# Altium project CAN_Display.PrjPcb (part 2 of 2)

## Sheet 04_MCU.SchDoc
size A3; SheetNumber: 4; SheetTotal: 6
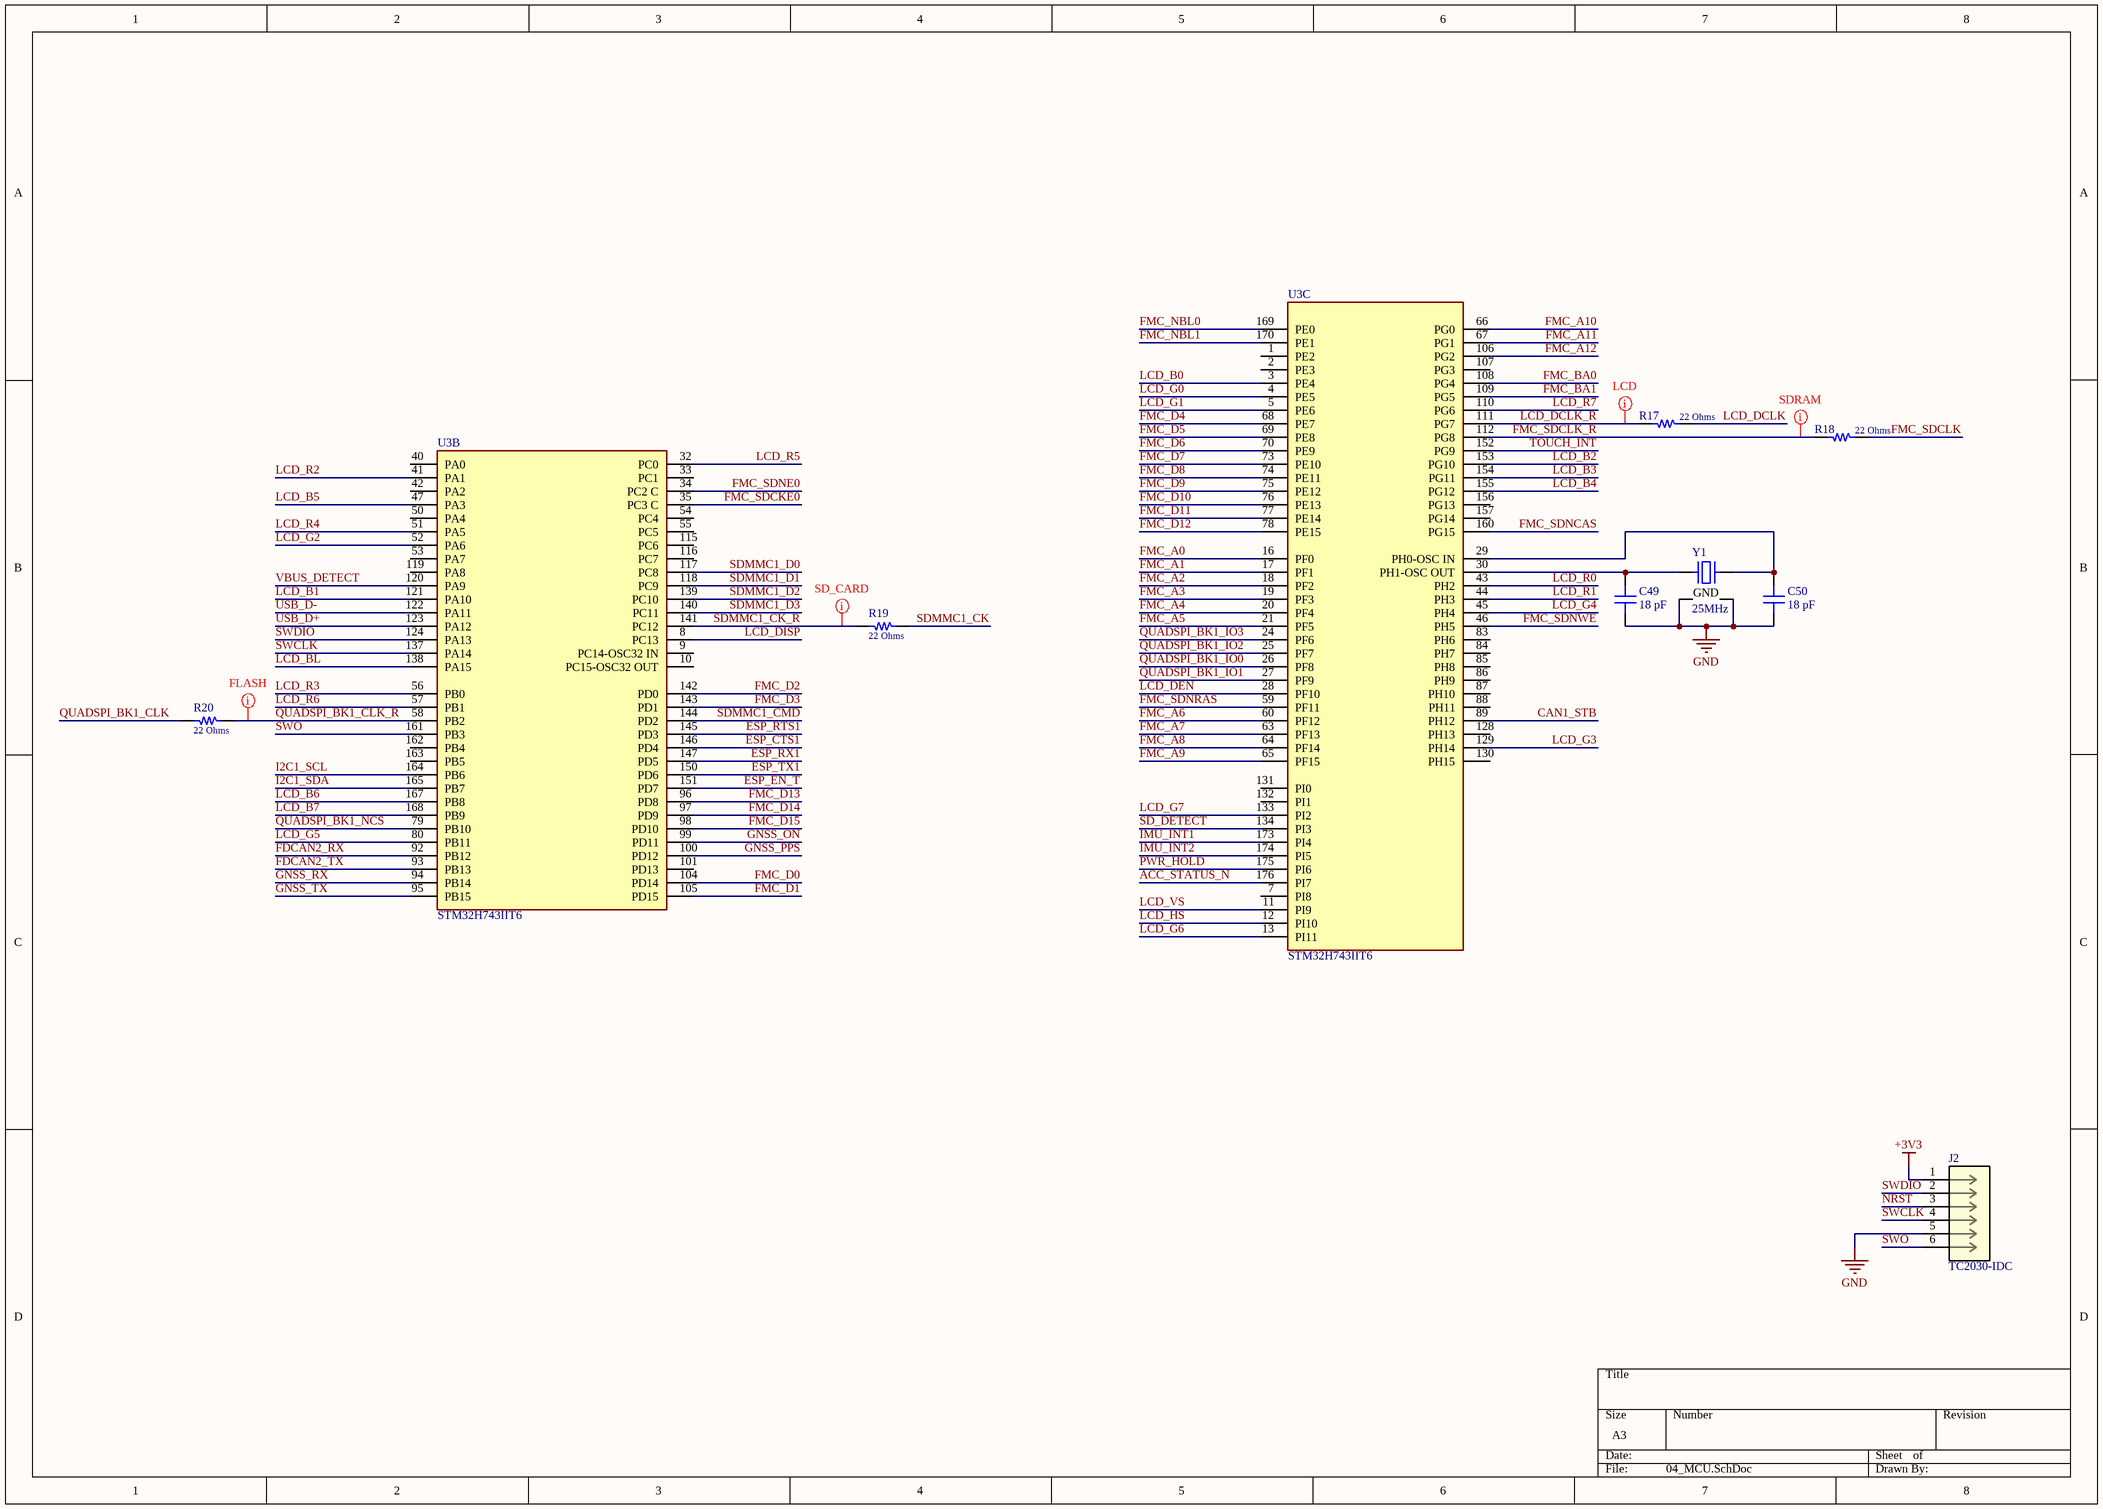
[diagram p3: 04_MCU.SchDoc]

### Parts
C49  18 pF  [CAP 0402_1005]
C50  18 pF  [CAP 0402_1005]
J2  TC2030-IDC  [CONN_TC2030-IDC_TGC]
R17  22 Ohms  [RES 0402_1005]
R18  22 Ohms  [RES 0402_1005]
R19  22 Ohms  [RES 0402_1005]
R20  22 Ohms  [RES 0402_1005]
U3  STM32H743IIT6  [FP-LQFP176-1T-MFG]  (parts B,C of 3)
Y1  25MHz  [NDK NX3225SA]

### Nets
+3V3: J2.1
GND: C49.1 C50.1 J2.5 Y1.2(GND) Y1.4(GND)
ACC_STATUS_N: U3.176(PI7)
CAN1_STB: U3.89(PH12)
ESP_CTS1: U3.146(PD4)
ESP_EN_T: U3.151(PD7)
ESP_RTS1: U3.145(PD3)
ESP_RX1: U3.147(PD5)
ESP_TX1: U3.150(PD6)
FDCAN2_RX: U3.92(PB12)
FDCAN2_TX: U3.93(PB13)
FMC_A0: U3.16(PF0)
FMC_A1: U3.17(PF1)
FMC_A2: U3.18(PF2)
FMC_A3: U3.19(PF3)
FMC_A4: U3.20(PF4)
FMC_A5: U3.21(PF5)
FMC_A6: U3.60(PF12)
FMC_A7: U3.63(PF13)
FMC_A8: U3.64(PF14)
FMC_A9: U3.65(PF15)
FMC_A10: U3.66(PG0)
FMC_A11: U3.67(PG1)
FMC_A12: U3.106(PG2)
FMC_BA0: U3.108(PG4)
FMC_BA1: U3.109(PG5)
FMC_D0: U3.104(PD14)
FMC_D1: U3.105(PD15)
FMC_D2: U3.142(PD0)
FMC_D3: U3.143(PD1)
FMC_D4: U3.68(PE7)
FMC_D5: U3.69(PE8)
FMC_D6: U3.70(PE9)
FMC_D7: U3.73(PE10)
FMC_D8: U3.74(PE11)
FMC_D9: U3.75(PE12)
FMC_D10: U3.76(PE13)
FMC_D11: U3.77(PE14)
FMC_D12: U3.78(PE15)
FMC_D13: U3.96(PD8)
FMC_D14: U3.97(PD9)
FMC_D15: U3.98(PD10)
FMC_NBL0: U3.169(PE0)
FMC_NBL1: U3.170(PE1)
FMC_SDCKE0: U3.35(PC3_C)
FMC_SDCLK: R18.1
FMC_SDCLK_R: R18.2 U3.112(PG8)
FMC_SDNCAS: U3.160(PG15)
FMC_SDNE0: U3.34(PC2_C)
FMC_SDNRAS: U3.59(PF11)
FMC_SDNWE: U3.46(PH5)
GNSS_ON: U3.99(PD11)
GNSS_PPS: U3.100(PD12)
GNSS_RX: U3.94(PB14)
GNSS_TX: U3.95(PB15)
I2C1_SCL: U3.164(PB6)
I2C1_SDA: U3.165(PB7)
IMU_INT1: U3.173(PI4)
IMU_INT2: U3.174(PI5)
LCD_B0: U3.3(PE4)
LCD_B1: U3.121(PA10)
LCD_B2: U3.153(PG10)
LCD_B3: U3.154(PG11)
LCD_B4: U3.155(PG12)
LCD_B5: U3.47(PA3)
LCD_B6: U3.167(PB8)
LCD_B7: U3.168(PB9)
LCD_BL: U3.138(PA15)
LCD_DCLK: R17.1
LCD_DCLK_R: R17.2 U3.111(PG7)
LCD_DEN: U3.28(PF10)
LCD_DISP: U3.8(PC13)
LCD_G0: U3.4(PE5)
LCD_G1: U3.5(PE6)
LCD_G2: U3.52(PA6)
LCD_G3: U3.129(PH14)
LCD_G4: U3.45(PH4)
LCD_G5: U3.80(PB11)
LCD_G6: U3.13(PI11)
LCD_G7: U3.133(PI2)
LCD_HS: U3.12(PI10)
LCD_R0: U3.43(PH2)
LCD_R1: U3.44(PH3)
LCD_R2: U3.41(PA1)
LCD_R3: U3.56(PB0)
LCD_R4: U3.51(PA5)
LCD_R5: U3.32(PC0)
LCD_R6: U3.57(PB1)
LCD_R7: U3.110(PG6)
LCD_VS: U3.11(PI9)
NRST: J2.3
PWR_HOLD: U3.175(PI6)
QUADSPI_BK1_CLK: R20.2
QUADSPI_BK1_CLK_R: R20.1 U3.58(PB2)
QUADSPI_BK1_IO0: U3.26(PF8)
QUADSPI_BK1_IO1: U3.27(PF9)
QUADSPI_BK1_IO2: U3.25(PF7)
QUADSPI_BK1_IO3: U3.24(PF6)
QUADSPI_BK1_NCS: U3.79(PB10)
SD_DETECT: U3.134(PI3)
SDMMC1_CK: R19.1
SDMMC1_CK_R: R19.2 U3.141(PC12)
SDMMC1_CMD: U3.144(PD2)
SDMMC1_D0: U3.117(PC8)
SDMMC1_D1: U3.118(PC9)
SDMMC1_D2: U3.139(PC10)
SDMMC1_D3: U3.140(PC11)
SWCLK: J2.4 U3.137(PA14)
SWDIO: J2.2 U3.124(PA13)
SWO: J2.6 U3.161(PB3)
TOUCH_INT: U3.152(PG9)
USB_D+: U3.123(PA12)
USB_D-: U3.122(PA11)
VBUS_DETECT: U3.120(PA9)
NetC49_2: C49.2 U3.30(PH1-OSC_OUT) Y1.1
NetC50_2: C50.2 U3.29(PH0-OSC_IN) Y1.3

Not connected (* = marked no-connect by the designer): U3 1(PE2) 2(PE3) 7(PI8) 9(PC14-OSC32_IN) 10(PC15-OSC32_OUT) 33(PC1) 40(PA0) 42(PA2) 50(PA4) 53(PA7) 54(PC4) 55(PC5) 83(PH6) 84(PH7) 85(PH8) 86(PH9) 87(PH10) 88(PH11) 101(PD13) 107(PG3) 115(PC6) 116(PC7) 119(PA8) 128(PH13) 130(PH15) 131(PI0) 132(PI1) 156(PG13) 157(PG14) 162(PB4) 163(PB5)

### Layout directives
mark named SD_CARD: SDMMC1_CK_R
mark named FLASH: QUADSPI_BK1_CLK_R
mark named SDRAM: FMC_SDCLK_R
mark named LCD: LCD_DCLK_R

### Library data of the parts
C49 C50 = CC0402JRNPO9BN180: CAP CER 18PF 50V C0G/NPO 0402; Manufacturer: Yageo; id: 1151; Temperature Coefficient: C0G, NP0; Tolerance: ±5%; Part Number: CC0402JRNPO9BN180; Value: 18 pF; Supplier Part Number 1: 311-1415-1-ND; ComponentLink2Description: DigiKey Link; ComponentLink1URL: https://www.yageo.com/upload/media/product/productsearch/datasheet/mlcc/UPY-GP_NP0_16V-to-50V_17.pdf; PartId: 4846; Supplier 1: DigiKey; Series: CC; LastUpdated: 2023-01-03T20:04:10.103; Part Status: Active; Capacitance: 18 pF; Device Package: 0402 (1005 Metric); Thickness (Max): 0.022" (0.55mm); Voltage - Rated: 50V; Minimum Order: 1; Packaging: CutTape; Applications: General Purpose; Package / Case: 0402 (1005 Metric); ComponentLink1Description: Datasheet; Price: 0.01; ComponentLink2URL: https://www.digikey.com/en/products/detail/yageo/CC0402JRNPO9BN180/2833580; Lifecycle Status: Active; Operating Temperature: -55°C ~ 125°C; Size / Dimension: 0.039" L x 0.020" W (1.00mm x 0.50mm); Mounting Type: Surface Mount, MLCC
J2 = TC2030-IDC: Description; Manufacturer_Name: Tag-Connect; Copyright: Copyright (C) 2025 Ultra Librarian. All rights reserved.; Manufacturer_Part_Number: TC2030-IDC; RefDes: RefDes; Type: Type
R17-R20 = RC0402FR-0722RL: RES 22 OHM 1% 1/16W 0402; Manufacturer: Yageo; id: 7818; Temperature Coefficient: ±100ppm/°C; Power (Watts): 0.063W, 1/16W; Part Number: RC0402FR-0722RL; Height - Seated (Max): 0.016" (0.40mm); Supplier Part Number 1: 311-22.0LRCT-ND; Supplier Device Package: 0402; ComponentLink1Description: Datasheet; ComponentLink2URL: https://www.digikey.com/en/products/detail/yageo/RC0402FR-0722RL/726562; Features: Moisture Resistant; ComponentLink1URL: https://www.yageo.com/upload/media/product/productsearch/datasheet/rchip/PYu-RC_Group_51_RoHS_L_10.pdf; Composition: Thick Film; Tolerance: ±1%; Supplier 1: DigiKey; Series: RC_L; Part Status: Active; ComponentLink2Description: DigiKey Link; Device Package: 0402 (1005 Metric); Packaging: CutTape; Minimum Order: 1; Package / Case: 0402 (1005 Metric); PartId: 17600; Lifecycle Status: Active; LastUpdated: 2023-01-02T20:20:45.730; Operating Temperature: -55°C ~ 155°C; Number Of Terminations: 2; Value: 22 Ohms; Size / Dimension: 0.039" L x 0.020" W (1.00mm x 0.50mm); Price: 0.01; Resistance: 22 Ohms
U3 = CMP-12105-000078-1: IC MCU 32BIT 2MB FLASH 176LQFP; Manufacturer: STMicroelectronics; Number Of I/Os: 140; Number Of Pwm Channels: 2; Standoff Height: 0.05mm; Number Of Uart Channels: 9; Frequency: 400MHz; Core Architecture: ARM Cortex-M7; Ram Size: 1MBytes; Max Supply Voltage: 3.6V; Number Of Timers/Counters: 20; Min Supply Voltage: 1.62V; Number Of I2C Channels: 4; Number Of Cores: 1; Max Junction Temp: +125°C; Data Bus Width: 32bits; Memory Size: 2MBytes; Number Of Adc Channels: 36; Number Of Spi Channels: 6; Interface: I2C,SPI,UART,USART,CAN,USB,LIN,IrDA,Ethernet,SMBus,Other; Number Of A/D Converters: 3; Digikey Description: IC MCU 32BIT 2MB FLASH 176LQFP; Temperature: -40°C to +125°C; Package: LQFP176-1T; RoHS: TRUE; Memory Type: FLASH; Device Class L3: Microcontrollers; Manufacturer Part Number: STM32H743IIT6; Mouser Description: MCU 32-Bit STM32 ARM Cortex M7 RISC 2MB Flash 1.8V/2.5V/3.3V 176-Pin LQFP Tray; Category: IC; Automotive: No; Ambient Temperature Range High: +85°C; Number Of Usb Channels: 2; ComponentLink2URL: https://www.st.com/resource/en/datasheet/stm32h743ii.pdf; Lead Free: Yes; Ambient Temperature Range Low: -40°C; ComponentLink2Description: Datasheet; Device Class L2: Embedded Processors and Controllers; Octopart: https://octopart.com/stm32h743iit6-stmicroelectronics-76372526; Device Class L1: Integrated Circuits (ICs); Height: 1.6mm; Temperature Range Low: -40°C; Temperature Range High: +125°C; Number Of Ethernet Channels: 1; Ipc Land Pattern Name: QFP50P2600X2600X160-176
Y1 = YXC X322525MOB4SI: CRYSTAL 25MHz 12pF SMD; Value: 25MHz

## Sheet 05_Peripherals.SchDoc
size A3; SheetNumber: 5; SheetTotal: 6
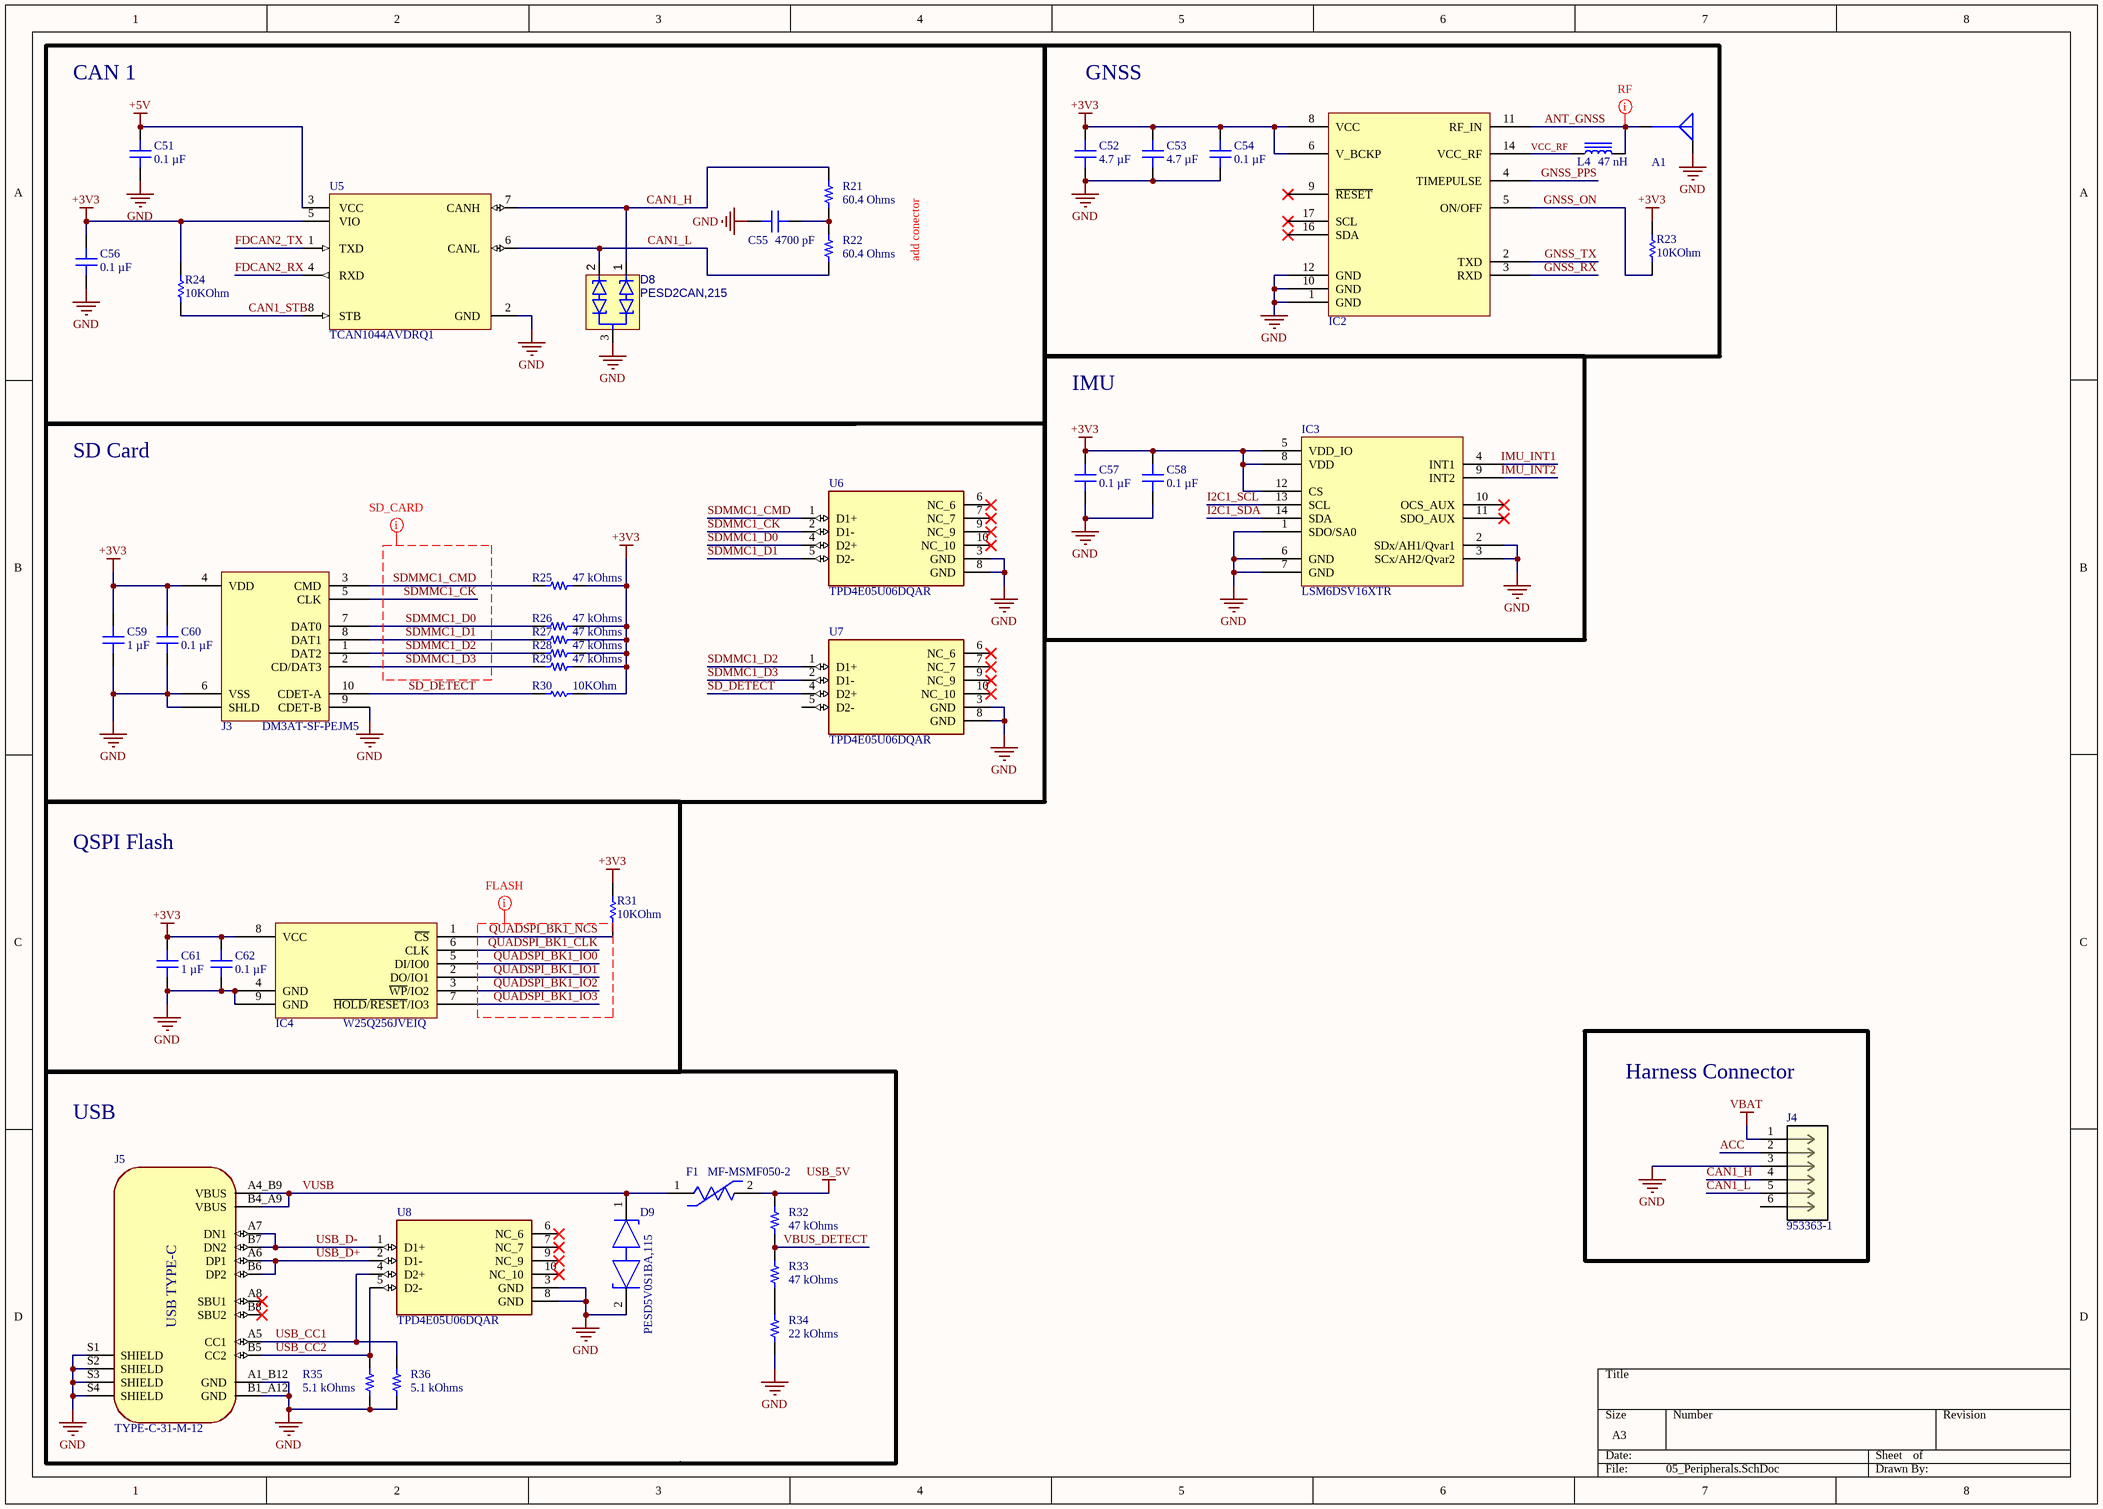
[diagram p4: 05_Peripherals.SchDoc]

### Parts
A1  1909763-1  [TE C-1909763]  (value not drawn)
C51  0.1 µF  [CAP 0402_1005]
C52  4.7 µF  [CAP 0603_1608]
C53  4.7 µF  [CAP 0603_1608]
C54  0.1 µF  [CAP 0402_1005]
C55  4700 pF  [CAP 0402_1005]
C56  0.1 µF  [CAP 0402_1005]
C57  0.1 µF  [CAP 0402_1005]
C58  0.1 µF  [CAP 0402_1005]
C59  1 µF  [CAP 0603_1608]
C60  0.1 µF  [CAP 0402_1005]
C61  1 µF  [CAP 0603_1608]
C62  0.1 µF  [CAP 0402_1005]
D8  PESD2CAN,215  [SOT95P230X110-3N]
D9  PESD5V0S1BA,115  [FP-SOD323-CA-MFG]
F1  MF-MSMF050-2  [FP-MF-MSMF050-2-MFG]
IC2  ATGM336H-5N  [U-BLOX MAX-8Q]  (value not drawn)
IC3  LSM6DSV16XTR  [STM LGA-14L 2.5x3.0MM]
IC4  W25Q256JVEIQ  [WINBOND WSON-8 8x6MM E]
J3  DM3AT-SF-PEJM5  [HIROSE DM3AT-SF-PEJM5]
J4  953363-1  [CONN6_953363-1_TEC]
J5  TYPE-C-31-M-12  [HRO_TYPE-C-31-M-12]
L4  47 nH  [IND 0402_1005 RF WW]
R21  60.4 Ohms  [RES 0603_1608]
R22  60.4 Ohms  [RES 0603_1608]
R23  10KOhm  [RESC1005X40X25LL05T05]
R24  10KOhm  [RESC1005X40X25LL05T05]
R25  47 kOhms  [RES 0402_1005]
R26  47 kOhms  [RES 0402_1005]
R27  47 kOhms  [RES 0402_1005]
R28  47 kOhms  [RES 0402_1005]
R29  47 kOhms  [RES 0402_1005]
R30  10KOhm  [RESC1005X40X25LL05T05]
R31  10KOhm  [RESC1005X40X25LL05T05]
R32  47 kOhms  [RES 0402_1005]
R33  47 kOhms  [RES 0402_1005]
R34  22 kOhms  [RES 0402_1005]
R35  5.1 kOhms  [RES 0402_1005]
R36  5.1 kOhms  [RES 0402_1005]
U5  TCAN1044AVDRQ1  [D0008A_MFG]
U6  TPD4E05U06DQAR  [IC_TPD4E05U06DQAR]
U7  TPD4E05U06DQAR  [IC_TPD4E05U06DQAR]
U8  TPD4E05U06DQAR  [IC_TPD4E05U06DQAR]

### Blocks framed on the sheet
GNSS: A1 C52-C54 IC2 L4 R23
IMU: C57 C58 IC3
SD Card: C59 C60 J3 R25-R30 U6 U7
QSPI Flash: C61 C62 IC4 R31
Harness Connector: J4
USB: D9 F1 J5 R32-R36 U8

### Nets
+3V3: C52.2 C53.2 C54.2 C56.2 C57.2 C58.2 C59.2 C60.2 C61.2 C62.2 IC2.6(V_BCKP) IC2.8(VCC) IC3.5(VDD_IO) IC3.8(VDD) IC3.12(CS) IC4.8(VCC) J3.4(VDD) R23.1 R24.1 R25.1 R26.1 R27.1 R28.1 R29.1 R30.1 R31.1 U5.5(VIO)
+5V: C51.2 U5.3(VCC)
GND: A1.G C51.1 C52.1 C53.1 C54.1 C55.1 C56.1 C57.1 C58.1 C59.1 C60.1 C61.1 C62.1 D8.3 D9.2(K2) IC2.1(GND) IC2.10(GND) IC2.12(GND) IC3.1(SDO/SA0) IC3.2(SDx/AH1/Qvar1) IC3.3(SCx/AH2/Qvar2) IC3.6(GND) IC3.7(GND) IC4.4(GND) IC4.9(GND) J3.6(VSS) J3.9(CDET-B) J3.S(SHLD) J4.3 J5.A1_B12(GND) J5.B1_A12(GND) J5.S1(SHIELD) J5.S2(SHIELD) J5.S3(SHIELD) J5.S4(SHIELD) R34.1 R35.1 R36.1 U5.2(GND) U6.3(GND) U6.8(GND) U7.3(GND) U7.8(GND) U8.3(GND) U8.8(GND)
USB_5V: F1.2 R32.2
VBAT: J4.1
ACC: J4.2
ANT_GNSS: A1.S IC2.11(RF_IN) L4.2
CAN1_H: D8.1 J4.4 R21.2 U5.7(CANH)
CAN1_L: D8.2 J4.5 R22.1 U5.6(CANL)
CAN1_STB: R24.2 U5.8(STB)
FDCAN2_RX: U5.4(RXD)
FDCAN2_TX: U5.1(TXD)
GNSS_ON: IC2.5(ON/OFF) R23.2
GNSS_PPS: IC2.4(TIMEPULSE)
GNSS_RX: IC2.3(RXD)
GNSS_TX: IC2.2(TXD)
I2C1_SCL: IC3.13(SCL)
I2C1_SDA: IC3.14(SDA)
IMU_INT1: IC3.4(INT1)
IMU_INT2: IC3.9(INT2)
QUADSPI_BK1_CLK: IC4.6(CLK)
QUADSPI_BK1_IO0: IC4.5(DI/IO0)
QUADSPI_BK1_IO1: IC4.2(DO/IO1)
QUADSPI_BK1_IO2: IC4.3(~{WP}/IO2)
QUADSPI_BK1_IO3: IC4.7(~{HOLD}/~{RESET}/IO3)
QUADSPI_BK1_NCS: IC4.1(~{CS}) R31.2
SD_DETECT: J3.10(CDET-A) R30.2 U7.4(D2+)
SDMMC1_CK: J3.5(CLK) U6.2(D1-)
SDMMC1_CMD: J3.3(CMD) R25.2 U6.1(D1+)
SDMMC1_D0: J3.7(DAT0) R26.2 U6.4(D2+)
SDMMC1_D1: J3.8(DAT1) R27.2 U6.5(D2-)
SDMMC1_D2: J3.1(DAT2) R28.2 U7.1(D1+)
SDMMC1_D3: J3.2(CD/DAT3) R29.2 U7.2(D1-)
USB_CC1: J5.A5(CC1) R36.2 U8.4(D2+)
USB_CC2: J5.B5(CC2) R35.2 U8.5(D2-)
USB_D+: J5.A6(DP1) J5.B6(DP2) U8.2(D1-)
USB_D-: J5.A7(DN1) J5.B7(DN2) U8.1(D1+)
VBUS_DETECT: R32.1 R33.2
VCC_RF: IC2.14(VCC_RF) L4.1
VUSB: D9.1(K1) F1.1 J5.A4_B9(VBUS) J5.B4_A9(VBUS)
NetC55_2: C55.2 R21.1 R22.2
NetR33_1: R33.1 R34.2

Not connected (* = marked no-connect by the designer): IC2 9(~{RESET})* 16(SDA)* 17(SCL)*; IC3 10(OCS_AUX)* 11(SDO_AUX)*; J4 6; J5 A8(SBU1)* B8(SBU2)*; U6 6(NC_6)* 7(NC_7)* 9(NC_9)* 10(NC_10)*; U7 5(D2-) 6(NC_6)* 7(NC_7)* 9(NC_9)* 10(NC_10)*; U8 6(NC_6)* 7(NC_7)* 9(NC_9)* 10(NC_10)*

### Layout directives
mark named SD_CARD: SDMMC1_CK, SDMMC1_CMD, SDMMC1_D0, SDMMC1_D1, SDMMC1_D2, SDMMC1_D3
mark named FLASH: QUADSPI_BK1_CLK, QUADSPI_BK1_IO0, QUADSPI_BK1_IO1, QUADSPI_BK1_IO2, QUADSPI_BK1_IO3, QUADSPI_BK1_NCS
net class RF: ANT_GNSS

### Notes on the sheet
- CAN 1
- add conector
- (in symbol TYPE-C-31-M-12) USB TYPE-C

### Library data of the parts
A1 = 1909763-1: CONN UMCC JACK STR 50OHM SMD; Manufacturer: TE Connectivity AMP Connectors; id: 12; Contact Termination: Solder; Connector Type: Jack, Male Pin; Number Of Ports: 1; Connector Style: U.FL (UMCC); Frequency - Max: 6 GHz; Part Number: 1909763-1; Housing Color: Ivory; Supplier Part Number 1: A118077CT-ND; ComponentLink1Description: Datasheet; ComponentLink2URL: https://www.digikey.com/en/products/detail/te-connectivity-amp-connectors/1909763-1/4731728; ComponentLink1URL: https://www.te.com/commerce/DocumentDelivery/DDEController?Action=srchrtrv&DocNm=1909763&DocType=Customer+Drawing&DocLang=English; Fastening Type: Snap-On; Supplier 1: DigiKey; Series: -; Part Status: Active; Shield Termination: Solder; ComponentLink2Description: DigiKey Link; Packaging: TapeAndReel; Minimum Order: 1; Lifecycle Status: Active; LastUpdated: 2022-06-29T18:17:07.053; Mounting Type: Surface Mount; Impedance: 50Ohm; Price: 0.23
C51 C54 C56-C58 C60 C62 = CL05B104KO5NNNC: CAP CER 0.1UF 16V X7R 0402; Manufacturer: Samsung Electro-Mechanics; id: 1479; Tolerance: ±10%; Part Number: CL05B104KO5NNNC; Value: 0.1 µF; Temperature Coefficient: X7R; Supplier Part Number 1: 1276-1001-1-ND; ComponentLink2Description: DigiKey Link; ComponentLink1URL: http://www.samsungsem.com/kr/support/product-search/mlcc/CL05B104KO5NNNC.jsp; PartId: 6066; Supplier 1: DigiKey; Series: CL; LastUpdated: 2023-01-03T20:04:06.380; Part Status: Active; Capacitance: 0.1 µF; Device Package: 0402 (1005 Metric); Thickness (Max): 0.022" (0.55mm); Voltage - Rated: 16V; Minimum Order: 1; Packaging: CutTape; Applications: General Purpose; Package / Case: 0402 (1005 Metric); ComponentLink1Description: Datasheet; Price: 0.01; ComponentLink2URL: https://www.digikey.com/en/products/detail/samsung-electro-mechanics/CL05B104KO5NNNC/3886659; Lifecycle Status: Active; Operating Temperature: -55°C ~ 125°C; Size / Dimension: 0.039" L x 0.020" W (1.00mm x 0.50mm); Mounting Type: Surface Mount, MLCC
C52 C53 = CL10A475KP8NNNC: CAP CER 4.7UF 10V X5R 0603; Manufacturer: Samsung Electro-Mechanics; id: 830; Tolerance: ±10%; Part Number: CL10A475KP8NNNC; Value: 4.7 µF; Temperature Coefficient: X5R; Supplier Part Number 1: 1276-1044-1-ND; ComponentLink2Description: DigiKey Link; ComponentLink1URL: http://www.samsungsem.com/kr/support/product-search/mlcc/CL10A475KP8NNNC.jsp; PartId: 5671; Supplier 1: DigiKey; Series: CL; LastUpdated: 2023-01-03T20:07:38.840; Part Status: Active; Capacitance: 4.7 µF; Device Package: 0603 (1608 Metric); Thickness (Max): 0.035" (0.90mm); Voltage - Rated: 10V; Minimum Order: 1; Packaging: TapeAndReel; Applications: General Purpose; Package / Case: 0603 (1608 Metric); ComponentLink1Description: Datasheet; Price: 0.01; ComponentLink2URL: https://www.digikey.com/en/products/detail/samsung-electro-mechanics/CL10A475KP8NNNC/3886702; Lifecycle Status: Active; Operating Temperature: -55°C ~ 85°C; Size / Dimension: 0.063" L x 0.031" W (1.60mm x 0.80mm); Mounting Type: Surface Mount, MLCC
C55 = C0402C472K4RECAUTO: CAP CER 0402 4.7NF 16V X7R 10%; Manufacturer: KEMET; id: 3032; Part Number: C0402C472K4RECAUTO; Value: 4700 pF; Temperature Coefficient: X7R; Supplier Part Number 1: 399-17875-1-ND; ComponentLink2Description: DigiKey Link; ComponentLink1URL: https://api.kemet.com/component-edge/download/datasheet/C0402C472K4RECAUTO.pdf; PartId: 12122; Tolerance: ±10%; Supplier 1: DigiKey; Series: ESD SMD Auto X7R; LastUpdated: 2023-01-03T20:03:46.940; Part Status: Active; Capacitance: 4700 pF; Device Package: 0402 (1005 Metric); Ratings: AEC-Q200; Thickness (Max): 0.022" (0.55mm); Voltage - Rated: 16V; Minimum Order: 1; Packaging: TapeAndReel; Applications: Automotive, ESD Protection; Package / Case: 0402 (1005 Metric); ComponentLink1Description: Datasheet; Price: 0.01; ComponentLink2URL: https://www.digikey.com/en/products/detail/kemet/C0402C472K4RECAUTO/8640469; Lifecycle Status: Active; Operating Temperature: -55°C ~ 125°C; Size / Dimension: 0.039" L x 0.020" W (1.00mm x 0.50mm); Mounting Type: Surface Mount, MLCC
C59 C61 = C0603C105K4RACAUTO: CAP CER 1UF 16V X7R 0603; Manufacturer: KEMET; id: 14; Tolerance: ±10%; Part Number: C0603C105K4RACAUTO; Value: 1 µF; Temperature Coefficient: X7R; Supplier Part Number 1: 399-17704-2-ND; ComponentLink2Description: DigiKey Link; ComponentLink1URL: https://api.kemet.com/component-edge/download/datasheet/C0603C105K4RACAUTO.pdf; PartId: 2179; Supplier 1: DigiKey; Series: SMD Auto X7R; LastUpdated: 2023-01-03T20:07:48.393; Part Status: Active; Capacitance: 1 µF; Device Package: 0603 (1608 Metric); Ratings: AEC-Q200; Thickness (Max): 0.037" (0.95mm); Voltage - Rated: 16V; Minimum Order: 0; Applications: Automotive, Bypass, Decoupling; Package / Case: 0603 (1608 Metric); ComponentLink1Description: Datasheet; Price: 0; ComponentLink2URL: https://www.digikey.com/en/products/detail/kemet/C0603C105K4RACAUTO/8635831; Lifecycle Status: Active; Operating Temperature: -55°C ~ 125°C; Size / Dimension: 0.063" L x 0.031" W (1.60mm x 0.80mm); Mounting Type: Surface Mount, MLCC
D8 = CMP-004-00031-1: 5A 230W 41V 26.2V Bidirectional 24V SOT-23 ESD and Surge Protection (TVS/ESD) ROHS; Manufacturer Lifecycle Status: RELEASED FOR SUPPLY; Element Configuration: Dual; Peak Reverse Current: 10nA; Power Line Protection: No; Number of Bidirectional Channels: 2; Leakage Current: 50nA; Breakdown Voltage: 28V; Number of Channels: 1; Value: 17pF; ESD Protection: Yes; Max Breakdown Voltage: 30.3V; Max Junction Temperature (Tj): 150°C; Test Current: 1mA; Pins: 3; Composition: Zener; Case/Package: SOT-23; Width: 1.4mm; China RoHS: Compliant; Ratings: AEC-Q101; Depth: 1.4mm; Max Operating Temperature: 150°C; Clamping Voltage: 41V; Min Breakdown Voltage: 26.2V; Termination: SMD/SMT; Peak Pulse Power: 230W; Peak Pulse Current: 5A; Height: 1.1mm; Contact Plating: Tin; Min Operating Temperature: -55°C; Mounting Technology: Surface Mount; Ambient Temperature Range High: 150°C; RoHS: Compliant; Max Reverse Leakage Current: 10nA; Reverse Breakdown Voltage: 26.2V; Number of Terminals: 3; Reverse Standoff Voltage: 24V; Polarity: Bidirectional; Schedule B: 8541100050, 8541100050; REACH SVHC: Unaffected; Length: 3mm; Number of Elements: 1; Working Voltage: 24V; Max Surge Current: 5A; Operating Supply Voltage: 24V; Radiation Hardening: No; Lead Free: Lead Free; Max Power Dissipation: 230W; Direction: Bidirectional; Weight: 4.535924g; Lifecycle Status: Production
D9 = CMP-14432-000001-1: TVS DIODE 5V 14V SOD323
F1 = CMP-2100-03653-2: PTC RESET FUSE 15V 500MA 1812; Manufacturer: Bourns; Value: 0.15-1Ω; Trip Current: 1A; Automotive Grade: Grade 3; Trip Time: 0.15s; Current Rating: 100A; Hold Current: 0.5A; Height: 0.85mm; Package: 1812; Voltage Rating: 15V; Temperature Range High: +85°C; Device Class L2: PTC Resettable Fuses; Lead Free: Yes; ComponentLink2URL: http://www.bourns.com/docs/Product-Datasheets/mfmsmf.pdf; Ambient Temperature Range High: +85°C; Mouser Description: PTC Resettable Fuse 0.5A(hold) 1A(trip) 15V 100A 0.8W 0.15s 0.15Ohm SMD Solder Pad 1812 T/R; Digikey Description: PTC RESET FUSE 15V 500MA 1812; Manufacturer Part Number: MF-MSMF050-2; Resistance: 0.15-1Ω; Category: Fuse; ComponentLink2Description: Datasheet; Automotive: Yes; Temperature Range Low: -40°C; RoHS: TRUE; Device Class L1: Circuit Protection; Temperature: -40°C to +85°C; Octopart: https://octopart.com/mf-msmf050-2-bourns-28047; Ambient Temperature Range Low: -40°C; Device Class L3: unset
IC2 = ATGM336H-5N: RF RX GLONASS/GNSS/GPS 1.575GHZ; id: 1; Voltage - Supply: 2.7V ~ 3.6V; Data Interface: I²C, UART; Part Number: ATGM336H-5N; ComponentLink1Description: Datasheet; ComponentLink1URL: https://github.com/YahboomTechnology/GPS_Module/blob/main/1.GPS%20module%20information/ATGM336H-5N%20Datasheet_EN.pdf; Series: ATGM336H-5N
IC3 = STM LSM6DSV16X: INEMO 3D ACCELEROMETER AND 3D GY; Manufacturer: STMicroelectronics; id: 1; Output Type: I2C, SPI; Sensor Type: Accelerometer, Gyroscope, Temperature, 6 Axis; Part Number: LSM6DSV16XTR; ComponentLink2URL: https://www.digikey.com/en/products/detail/stmicroelectronics/LSM6DSV16XTR/16841485; Price: 2.76; Supplier 1: DigiKey; ComponentLink1Description: Datasheet; ComponentLink2Description: DigiKey Link; Minimum Order: 1; Supplier Part Number 1: 497-LSM6DSV16XTRCT-ND; Operating Temperature: -40°C ~ 85°C; Mounting Type: Surface Mount; Supplier Device Package: 14-LGA (2.5x3); ComponentLink1URL: https://www.st.com/content/ccc/resource/technical/document/datasheet/group3/47/03/b2/44/47/32/4b/76/DM00741844/files/DM00741844.pdf/jcr:content/translations/en.DM00741844.pdf; Packaging: TapeAndReel; Series: -; LastUpdated: 2026-02-04T10:16:47.433; Lifecycle Status: Active
IC4 = W25Q256JVEIQ: IC FLASH 256MBIT SPI/QUAD 8WSON; Manufacturer: Winbond Electronics; id: 620; Memory Size: 256Mb (32M x 8); Voltage - Supply: 2.7V ~ 3.6V; Write Cycle Time - Word, Page: 3ms; Memory Type: Non-Volatile; Clock Frequency: 133 MHz; Memory Interface: SPI - Quad I/O; Part Number: W25Q256JVEIQ; Supplier Part Number 1: W25Q256JVEIQ-ND; Supplier Device Package: 8-WSON (8x6); ComponentLink1Description: Datasheet; Memory Format: FLASH; ComponentLink2URL: https://www.digikey.com/en/products/detail/winbond-electronics/W25Q256JVEIQ/6810681; ComponentLink1URL: http://www.winbond.com/resource-files/w25q256jv%20spi%20revg%2008032017.pdf; Supplier 1: DigiKey; Series: SpiFlash®; Part Status: Active; ComponentLink2Description: DigiKey Link; Packaging: Tube; Minimum Order: 1; Package / Case: 8-WDFN Exposed Pad; PartId: 1453; Lifecycle Status: Active; LastUpdated: 2024-08-29T14:07:08.517; Technology: FLASH - NOR; Operating Temperature: -40°C ~ 85°C (TA); Mounting Type: Surface Mount; Price: 2.50
J3 = DM3AT-SF-PEJM5: CONN MICRO SD CARD PUSH-PUSH R/A; Manufacturer: Hirose Electric Co Ltd; id: 1; Connector Type: Connector and Ejector; Number Of Positions: 10 (8 + 2); Insertion, Removal Method: Push In, Push Out; Card Type: Secure Digital - microSD™; Part Number: DM3AT-SF-PEJM5; Height Above Board: 0.066" (1.68mm); Supplier Part Number 1: HR1964TR-ND; ComponentLink1Description: Datasheet; ComponentLink2URL: //digikey.com/product-detail/en/hirose-electric-co-ltd/DM3AT-SF-PEJM5/HR1964TR-ND/2533565; Features: Switch; ComponentLink1URL: https://www.hirose.com/product/document?clcode=CL0609-0033-6-00&productname=DM3AT-SF-PEJ2M5&series=DM3&documenttype=Catalog&lang=en&documentid=D49662_en; Mounting Feature: Normal, Standard - Top; Supplier 1: DigiKey; Series: DM3; Part Status: Active; ComponentLink2Description: DigiKey Link; Packaging: TapeAndReel; Minimum Order: 1; Contact Finish: Gold; Lifecycle Status: 0; LastUpdated: 2019-12-16T20:34:40.023; Mounting Type: Surface Mount, Right Angle; Price: 1.41
J4 = 953363-1: 6pos MQS .63 header 180deg; Manufacturer_Name: TE Connectivity; TYPE: -; Copyright: Copyright (C) 2026 Ultra Librarian. All rights reserved.; Manufacturer_Part_Number: 953363-1; Datasheet: https://www.te.com/commerce/DocumentDelivery/DDEController?Action=srchrtrv&DocNm=108-15199&DocType=Specification+Or+Standard&DocLang=English&PartCntxt=953363-3&DocFormat=pdf; RefDes: RefDes
J5 = TYPE-C-31-M-12: USB Connectors 24 Receptacle 1 8.94*7.3mm RoHS; MF: HRO Electronics Co., Ltd.; SnapEDA_Link: https://www.snapeda.com/parts/TYPE-C-31-M-12/HRO+Electronics+Co.%252C+Ltd./view-part/?ref=snap; Package: Package; Value: *; MP: TYPE-C-31-M-12; Check_prices: https://www.snapeda.com/parts/TYPE-C-31-M-12/HRO+Electronics+Co.%252C+Ltd./view-part/?ref=eda
L4 = LQW15AN47NJ00D: FIXED IND 47NH 210MA 1.08OHM SMD; Manufacturer: Murata Electronics; id: 266; Frequency - Self Resonant: 2.9GHz; Tolerance: ±5%; Type: Wirewound; Inductance Frequency - Test: 100 MHz; Q @ Freq: 25 @ 200MHz; Material - Core: Non-Magnetic; DC Resistance (DCR): 1.08Ohm Max; Shielding: Unshielded; Part Number: LQW15AN47NJ00D; Height - Seated (Max): 0.024" (0.60mm); Supplier Part Number 1: 490-1154-1-ND; Current Rating (Amps): 210 mA; Inductance: 47 nH; ComponentLink1Description: Datasheet; ComponentLink2URL: https://www.digikey.com/en/products/detail/murata-electronics/LQW15AN47NJ00D/584363; ComponentLink1URL: https://search.murata.co.jp/Ceramy/image/img/P02/JELF243A-0050.pdf; Supplier 1: DigiKey; Series: LQW15; Part Status: Active; ComponentLink2Description: DigiKey Link; Device Package: 0402 (1005 Metric); Packaging: TapeAndReel; Minimum Order: 1; Package / Case: 0402 (1005 Metric); PartId: 266; Lifecycle Status: Active; LastUpdated: 2023-01-02T20:59:31.513; Operating Temperature: -55°C ~ 125°C; Value: 47 nH; Size / Dimension: 0.039" L x 0.020" W (1.00mm x 0.50mm); Mounting Type: Surface Mount; Price: 0.05
R21 R22 = ERJ-PA3F60R4V: RES SMD 60.4 OHM 1% 1/3W 0603; Manufacturer: Panasonic Electronic Components; id: 21330; Temperature Coefficient: ±100ppm/°C; Power (Watts): 0.333W, 1/3W; Part Number: ERJ-PA3F60R4V; Height - Seated (Max): 0.022" (0.55mm); Supplier Part Number 1: 10-ERJ-PA3F60R4VCT-ND; Supplier Device Package: 0603; ComponentLink1Description: Datasheet; ComponentLink2URL: https://www.digikey.com/en/products/detail/panasonic-electronic-components/ERJ-PA3F60R4V/5037768; Features: Automotive AEC-Q200, Pulse Withstanding; ComponentLink1URL: https://industrial.panasonic.com/cdbs/www-data/pdf/RDO0000/AOA0000C331.pdf; Composition: Thick Film; Tolerance: ±1%; Supplier 1: DigiKey; Series: ERJ-PA3; ComponentLink2Description: DigiKey Link; Device Package: 0603 (1608 Metric); Packaging: TapeAndReel; Ratings: AEC-Q200; Minimum Order: 1; Package / Case: 0603 (1608 Metric); PartId: 82262; Lifecycle Status: Active; LastUpdated: 2023-10-29T19:35:03.690; Operating Temperature: -55°C ~ 155°C; Number Of Terminations: 2; Value: 60.4 Ohms; Size / Dimension: 0.063" L x 0.031" W (1.60mm x 0.80mm); Price: 0.01; Resistance: 60.4 Ohms
R23 R24 R30 R31 = CMP-2000-07588-1: Chip Resistor, 10 KOhm, +/- 1%, 0.1 W, -55 to 155 degC, 0402 (1005 Metric), RoHS, Tape and Reel; Manufacturer: Panasonic; Power Rating: 100mW; Voltage Rating: 50V; Case\/Package: 0402; Temperature Coefficient: 100ppm\/degreesC; RoHSCompliant: True; Lead Free: LeadFree; Package Quantity: 1; Contact Plating: Tin; Resistance: 10KOhm; Length: 1mm; Radiation Hardening: No; REACH SVHC: NoSVHC; Max Operating Temperature: 155degC; Depth: 0.5mm; Case Code (Imperial): 0402; Military Standard: Not; Package Description: 2-Pin Surface Mount Device, Body 1 x 0.5 mm; Termination: SMD/SMT; Case Code (Metric): 1005; Height: 0.35mm; Packaging: TapeandReel; Voltage Rating (DC): 50V; Package Reference: 402; Number of Pins: 2; Tolerance: 1%; Mounting Technology: SurfaceMount; Width: 0.02inch; Mount: SurfaceMount; Datasheet URL: https://industrial.panasonic.com/cdbs/www-data/pdf/RDA0000/AOA0000C304.pdf; Composition: ThickFilm; Datasheet Version: 02/2017; Manufacturer URL: http://www.panasonic.com/; Max Power Dissipation: 100mW; Number of Terminations: 2; Min Operating Temperature: -55degC
R25-R29 = RC0402FR-0747KL: RES 47K OHM 1% 1/16W 0402; Manufacturer: Yageo; id: 9309; Temperature Coefficient: ±100ppm/°C; Power (Watts): 0.063W, 1/16W; Part Number: RC0402FR-0747KL; Height - Seated (Max): 0.016" (0.40mm); Supplier Part Number 1: 311-47.0KLRCT-ND; Supplier Device Package: 0402; ComponentLink1Description: Datasheet; ComponentLink2URL: https://www.digikey.com/en/products/detail/yageo/RC0402FR-0747KL/726616; Features: Moisture Resistant; ComponentLink1URL: https://www.yageo.com/upload/media/product/productsearch/datasheet/rchip/PYu-RC_Group_51_RoHS_L_10.pdf; Composition: Thick Film; Tolerance: ±1%; Supplier 1: DigiKey; Series: RC_L; Part Status: Active; ComponentLink2Description: DigiKey Link; Device Package: 0402 (1005 Metric); Packaging: CutTape; Minimum Order: 1; Package / Case: 0402 (1005 Metric); PartId: 20550; Lifecycle Status: Active; LastUpdated: 2023-01-02T20:20:32.550; Operating Temperature: -55°C ~ 155°C; Number Of Terminations: 2; Value: 47 kOhms; Size / Dimension: 0.039" L x 0.020" W (1.00mm x 0.50mm); Price: 0.01; Resistance: 47 kOhms
R32 R33 = RMCF0402FT47K0: RES 47K OHM 1% 1/16W 0402; Manufacturer: Stackpole Electronics Inc; id: 1346; Temperature Coefficient: ±100ppm/°C; Power (Watts): 0.063W, 1/16W; Part Number: RMCF0402FT47K0; Height - Seated (Max): 0.016" (0.40mm); Supplier Part Number 1: RMCF0402FT47K0CT-ND; Supplier Device Package: 0402; ComponentLink1Description: Datasheet; ComponentLink2URL: https://www.digikey.com/en/products/detail/stackpole-electronics-inc/RMCF0402FT47K0/1714749; Features: Automotive AEC-Q200; ComponentLink1URL: https://www.seielect.com/catalog/sei-rmcf_rmcp.pdf; Composition: Thick Film; Tolerance: ±1%; Supplier 1: DigiKey; Series: RMCF; Part Status: Active; ComponentLink2Description: DigiKey Link; Device Package: 0402 (1005 Metric); Packaging: CutTape; Ratings: AEC-Q200; Minimum Order: 1; Package / Case: 0402 (1005 Metric); PartId: 4957; Lifecycle Status: Active; LastUpdated: 2023-01-02T20:21:41.127; Operating Temperature: -55°C ~ 155°C; Number Of Terminations: 2; Value: 47 kOhms; Size / Dimension: 0.039" L x 0.020" W (1.00mm x 0.50mm); Price: 0.01; Resistance: 47 kOhms
R34 = RT0402BRD0722KL: RES SMD 22K OHM 0.1% 1/16W 0402; Manufacturer: Yageo; id: 1014; Temperature Coefficient: ±25ppm/°C; Power (Watts): 0.063W, 1/16W; Part Number: RT0402BRD0722KL; Height - Seated (Max): 0.014" (0.35mm); Supplier Part Number 1: YAG4210CT-ND; Supplier Device Package: 0402; ComponentLink1Description: Datasheet; ComponentLink2URL: https://www.digikey.com/en/products/detail/yageo/RT0402BRD0722KL/1069136; ComponentLink1URL: https://www.yageo.com/upload/media/product/productsearch/datasheet/rchip/PYu-RT_1-to-0.01_RoHS_L_11.pdf; Composition: Thin Film; Tolerance: ±0.1%; Supplier 1: DigiKey; Series: RT; Part Status: Active; ComponentLink2Description: DigiKey Link; Device Package: 0402 (1005 Metric); Packaging: TapeAndReel; Minimum Order: 1; Package / Case: 0402 (1005 Metric); PartId: 4575; Lifecycle Status: Active; LastUpdated: 2023-01-02T20:21:43.577; Operating Temperature: -55°C ~ 155°C; Number Of Terminations: 2; Value: 22 kOhms; Size / Dimension: 0.039" L x 0.020" W (1.00mm x 0.50mm); Price: 0.04; Resistance: 22 kOhms
R35 R36 = RT0402BRE075K1L: RES SMD 5.1K OHM 0.1% 1/16W 0402; Manufacturer: Yageo; id: 1029; Temperature Coefficient: ±50ppm/°C; Power (Watts): 0.063W, 1/16W; Part Number: RT0402BRE075K1L; Height - Seated (Max): 0.014" (0.35mm); Supplier Part Number 1: YAG4404CT-ND; Supplier Device Package: 0402; ComponentLink1Description: Datasheet; ComponentLink2URL: http://digikey.com/product-detail/en/yageo/RT0402BRE075K1L/YAG4404CT-ND/6616560; ComponentLink1URL: https://www.yageo.com/upload/media/product/productsearch/datasheet/rchip/PYu-RT_1-to-0.01_RoHS_L_11.pdf; Composition: Thin Film; Tolerance: ±0.1%; Supplier 1: DigiKey; Series: RT; Part Status: Active; ComponentLink2Description: DigiKey Link; Device Package: 0402 (1005 Metric); Packaging: TapeAndReel; Minimum Order: 1; Package / Case: 0402 (1005 Metric); PartId: 4590; Lifecycle Status: Active; LastUpdated: 2023-01-02T20:21:43.473; Operating Temperature: -55°C ~ 155°C; Number Of Terminations: 2; Value: 5.1 kOhms; Size / Dimension: 0.039" L x 0.020" W (1.00mm x 0.50mm); Price: 0.04; Resistance: 5.1 kOhms
U5 = CMP-00370-122305019-1: Enhanced automotive CAN transceiver with standby 8-SOIC -40 to 150; Manufacturer Lifecycle Status: ACTIVE; Height: 1.75mm; HelpURL: https://www.ti.com/lit/ds/symlink/tcan1044a-q1.pdf; Case/Package: SOIC; Number of Pins: 8; Lifecycle Status: Production; Thickness: 1.58mm; ComponentLink1URL: http://ti.com; RoHS: Compliant; Length: 4.9mm; ComponentLink2Description: Datasheet URL; Width: 3.91mm; ComponentLink2URL: https://www.ti.com/lit/ds/symlink/tcan1044a-q1.pdf; ComponentLink1Description: Manufacturer's Website
U6-U8 = TPD4E05U06DQAR: Quad 0.5-pF, 5.5-V, Â±12-kV ESD protection diode for USB, HDMI & High Speed Interfaces; MF: Texas Instruments; Value: *; SnapEDA_Link: https://www.snapeda.com/parts/TPD4E05U06DQAR/Texas+Instruments/view-part/?ref=snap; Purchase-URL: https://pricing.snapeda.com/search/part/TPD4E05U06DQAR/?ref=eda; Availability: In Stock; Price: None; Package: USON-10 Texas Instruments; Check_prices: https://www.snapeda.com/parts/TPD4E05U06DQAR/Texas+Instruments/view-part/?ref=eda; MP: TPD4E05U06DQAR

## Sheet 06_WIFI_BLE.SchDoc
size A4; SheetNumber: 6; SheetTotal: 6
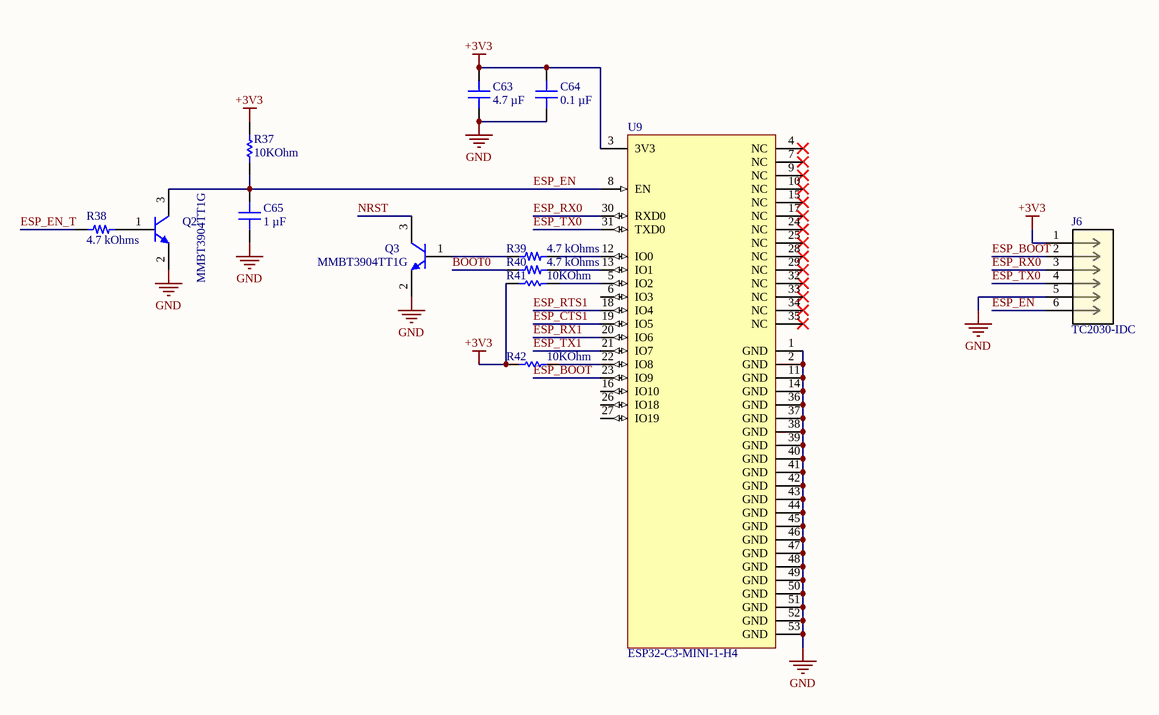
[diagram p5: 06_WIFI_BLE.SchDoc]

### Parts
C63  4.7 µF  [CAP 0603_1608]
C64  0.1 µF  [CAP 0402_1005]
C65  1 µF  [CAP 0603_1608]
J6  TC2030-IDC  [CONN_TC2030-IDC_TGC]
Q2  MMBT3904TT1G  [ON SEMICONDUCTOR SC-75]
Q3  MMBT3904TT1G  [ON SEMICONDUCTOR SC-75]
R37  10KOhm  [RESC1005X40X25LL05T05]
R38  4.7 kOhms  [RES 0402_1005]
R39  4.7 kOhms  [RES 0402_1005]
R40  4.7 kOhms  [RES 0402_1005]
R41  10KOhm  [RESC1005X40X25LL05T05]
R42  10KOhm  [RESC1005X40X25LL05T05]
U9  ESP32-C3-MINI-1-H4  [FP-ESP32-C3-MINI-1-H4-MFG]

### Nets
+3V3: C63.2 C64.2 J6.1 R37.2 R41.2 R42.2 U9.3(3V3)
GND: C63.1 C64.1 C65.1 J6.5 Q2.2(E) Q3.2(E) U9.1(GND) U9.2(GND) U9.11(GND) U9.14(GND) U9.36(GND) U9.37(GND) U9.38(GND) U9.39(GND) U9.40(GND) U9.41(GND) U9.42(GND) U9.43(GND) U9.44(GND) U9.45(GND) U9.46(GND) U9.47(GND) U9.48(GND) U9.49(GND) U9.50(GND) U9.51(GND) U9.52(GND) U9.53(GND)
BOOT0: R40.2
ESP_BOOT: J6.2 U9.23(IO9)
ESP_CTS1: U9.19(IO5)
ESP_EN: C65.2 J6.6 Q2.3(C) R37.1 U9.8(EN)
ESP_EN_T: R38.2
ESP_RTS1: U9.18(IO4)
ESP_RX0: J6.3 U9.30(RXD0)
ESP_RX1: U9.20(IO6)
ESP_TX0: J6.4 U9.31(TXD0)
ESP_TX1: U9.21(IO7)
NRST: Q3.3(C)
NetQ2_1: Q2.1(B) R38.1
NetQ3_1: Q3.1(B) R39.2
NetR39_1: R39.1 U9.12(IO0)
NetR40_1: R40.1 U9.13(IO1)
NetR41_1: R41.1 U9.5(IO2)
NetR42_1: R42.1 U9.22(IO8)

Not connected (* = marked no-connect by the designer): U9 4(NC)* 6(IO3) 7(NC)* 9(NC)* 10(NC)* 15(NC)* 16(IO10) 17(NC)* 24(NC)* 25(NC)* 26(IO18) 27(IO19) 28(NC)* 29(NC)* 32(NC)* 33(NC)* 34(NC)* 35(NC)*

### Library data of the parts
C63 = CL10A475KP8NNNC: as C52 on sheet 05_Peripherals; Part Number: CL10A475KP8NNNC; Value: 4.7 µF; Temperature Coefficient: X5R; Supplier Part Number 1: 1276-1044-1-ND; ComponentLink2Description: DigiKey Link; ComponentLink1URL: http://www.samsungsem.com/kr/support/product-search/mlcc/CL10A475KP8NNNC.jsp; PartId: 5671; Supplier 1: DigiKey; Series: CL; LastUpdated: 2023-01-03T20:07:38.840; Part Status: Active; Capacitance: 4.7 µF; Device Package: 0603 (1608 Metric); Thickness (Max): 0.035" (0.90mm); Voltage - Rated: 10V; Minimum Order: 1; Packaging: TapeAndReel; Applications: General Purpose; Package / Case: 0603 (1608 Metric); ComponentLink1Description: Datasheet; Price: 0.01; ComponentLink2URL: https://www.digikey.com/en/products/detail/samsung-electro-mechanics/CL10A475KP8NNNC/3886702; Lifecycle Status: Active; Operating Temperature: -55°C ~ 85°C; Size / Dimension: 0.063" L x 0.031" W (1.60mm x 0.80mm); Mounting Type: Surface Mount, MLCC
C64 = CL05B104KO5NNNC: as C51 on sheet 05_Peripherals; Part Number: CL05B104KO5NNNC; Value: 0.1 µF; Temperature Coefficient: X7R; Supplier Part Number 1: 1276-1001-1-ND; ComponentLink2Description: DigiKey Link; ComponentLink1URL: http://www.samsungsem.com/kr/support/product-search/mlcc/CL05B104KO5NNNC.jsp; PartId: 6066; Supplier 1: DigiKey; Series: CL; LastUpdated: 2023-01-03T20:04:06.380; Part Status: Active; Capacitance: 0.1 µF; Device Package: 0402 (1005 Metric); Thickness (Max): 0.022" (0.55mm); Voltage - Rated: 16V; Minimum Order: 1; Packaging: CutTape; Applications: General Purpose; Package / Case: 0402 (1005 Metric); ComponentLink1Description: Datasheet; Price: 0.01; ComponentLink2URL: https://www.digikey.com/en/products/detail/samsung-electro-mechanics/CL05B104KO5NNNC/3886659; Lifecycle Status: Active; Operating Temperature: -55°C ~ 125°C; Size / Dimension: 0.039" L x 0.020" W (1.00mm x 0.50mm); Mounting Type: Surface Mount, MLCC
C65 = C0603C105K4RACAUTO: as C59 on sheet 05_Peripherals; Part Number: C0603C105K4RACAUTO; Value: 1 µF; Temperature Coefficient: X7R; Supplier Part Number 1: 399-17704-2-ND; ComponentLink2Description: DigiKey Link; ComponentLink1URL: https://api.kemet.com/component-edge/download/datasheet/C0603C105K4RACAUTO.pdf; PartId: 2179; Supplier 1: DigiKey; Series: SMD Auto X7R; LastUpdated: 2023-01-03T20:07:48.393; Part Status: Active; Capacitance: 1 µF; Device Package: 0603 (1608 Metric); Ratings: AEC-Q200; Thickness (Max): 0.037" (0.95mm); Voltage - Rated: 16V; Minimum Order: 0; Applications: Automotive, Bypass, Decoupling; Package / Case: 0603 (1608 Metric); ComponentLink1Description: Datasheet; Price: 0; ComponentLink2URL: https://www.digikey.com/en/products/detail/kemet/C0603C105K4RACAUTO/8635831; Lifecycle Status: Active; Operating Temperature: -55°C ~ 125°C; Size / Dimension: 0.063" L x 0.031" W (1.60mm x 0.80mm); Mounting Type: Surface Mount, MLCC
J6 = TC2030-IDC: as J2 on sheet 04_MCU; Copyright: Copyright (C) 2025 Ultra Librarian. All rights reserved.; Manufacturer_Part_Number: TC2030-IDC; RefDes: RefDes; Type: Type
Q2 Q3 = MMBT3904TT1G: TRANS NPN 40V 0.2A SOT416; Manufacturer: ON Semiconductor; id: 34; Current - Collector (Ic) (Max): 200mA; Power - Max: 300mW; DC Current Gain (Hfe) (Min) @ Ic, Vce: 100 @ 10mA, 1V; Vce Saturation (Max) @ Ib, Ic: 300mV @ 5mA, 50mA; Frequency - Transition: 300MHz; Part Number: MMBT3904TT1G; Supplier Part Number 1: MMBT3904TT1GOSCT-ND; Supplier Device Package: SC-75, SOT-416; ComponentLink1Description: Datasheet; ComponentLink2URL: http://digikey.com/product-detail/en/on-semiconductor/MMBT3904TT1G/MMBT3904TT1GOSCT-ND/1139815; ComponentLink1URL: https://www.onsemi.com/pub/Collateral/MMBT3904TT1-D.PDF; Supplier 1: DigiKey; Series: -; Part Status: Active; ComponentLink2Description: DigiKey Link; Packaging: TapeAndReel; Minimum Order: 1; Transistor Type: NPN; Voltage - Collector Emitter Breakdown (Max): 40V; Package / Case: SC-75, SOT-416; PartId: 34; Lifecycle Status: Active; LastUpdated: 2023-01-02T21:11:02.333; Operating Temperature: -55°C ~ 150°C (TJ); Mounting Type: Surface Mount; Price: 0.02
R37 R41 R42 = CMP-2000-07588-1: as R23 on sheet 05_Peripherals; RoHSCompliant: True; Lead Free: LeadFree; Package Quantity: 1; Contact Plating: Tin; Resistance: 10KOhm; Length: 1mm; Radiation Hardening: No; REACH SVHC: NoSVHC; Max Operating Temperature: 155degC; Depth: 0.5mm; Case Code (Imperial): 0402; Military Standard: Not; Package Description: 2-Pin Surface Mount Device, Body 1 x 0.5 mm; Termination: SMD/SMT; Case Code (Metric): 1005; Height: 0.35mm; Packaging: TapeandReel; Voltage Rating (DC): 50V; Package Reference: 402; Number of Pins: 2; Tolerance: 1%; Mounting Technology: SurfaceMount; Width: 0.02inch; Mount: SurfaceMount; Datasheet URL: https://industrial.panasonic.com/cdbs/www-data/pdf/RDA0000/AOA0000C304.pdf; Composition: ThickFilm; Datasheet Version: 02/2017; Manufacturer URL: http://www.panasonic.com/; Max Power Dissipation: 100mW; Number of Terminations: 2; Min Operating Temperature: -55degC
R38-R40 = RC0402FR-074K7L: RES 4.7K OHM 1% 1/16W 0402; Manufacturer: Yageo; id: 7819; Temperature Coefficient: ±100ppm/°C; Power (Watts): 0.063W, 1/16W; Part Number: RC0402FR-074K7L; Height - Seated (Max): 0.016" (0.40mm); Supplier Part Number 1: 311-4.7KLRCT-ND; Supplier Device Package: 0402; ComponentLink1Description: Datasheet; ComponentLink2URL: https://www.digikey.com/en/products/detail/yageo/RC0402FR-074K7L/2827563; Features: Moisture Resistant; ComponentLink1URL: https://www.yageo.com/upload/media/product/productsearch/datasheet/rchip/PYu-RC_Group_51_RoHS_L_10.pdf; Composition: Thick Film; Tolerance: ±1%; Supplier 1: DigiKey; Series: RC_L; Part Status: Active; ComponentLink2Description: DigiKey Link; Device Package: 0402 (1005 Metric); Packaging: CutTape; Minimum Order: 1; Package / Case: 0402 (1005 Metric); PartId: 17603; Lifecycle Status: Active; LastUpdated: 2023-01-02T20:20:45.723; Operating Temperature: -55°C ~ 155°C; Number Of Terminations: 2; Value: 4.7 kOhms; Size / Dimension: 0.039" L x 0.020" W (1.00mm x 0.50mm); Price: 0.01; Resistance: 4.7 kOhms
U9 = CMP-10700-116589974-1: Multiprotocol Modules SMD module, ESP32-C3FH4, PCB antenna, -40 C +105 C; Data Rate: 150Mbps; Number of GPIO: 13; Current - Transmitting: 350mA; Max Frequency: 2.484GHz; Current - Receiving: 84mA; Max Supply Voltage: 3.6V; Min Supply Voltage: 3V; Interface: SPI; Min Operating Temperature: -40°C; Height: 2.55mm; Ambient Temperature Range High: 85°C; Max Operating Temperature: 85°C

## Nets that join several sheets
+3V3: 01_Power (49 pins), 02_Display (B1.1 C39.2 C40.2 J1.4), 03_SDRAM (15 pins), 04_MCU (J2.1), 05_Peripherals (27 pins), 06_WIFI_BLE (7 pins)
+5V: 01_Power (8 pins), 02_Display (C37.2 L3.1 U4.5), 05_Peripherals (C51.2 U5.3)
GND: 01_Power (64 pins), 02_Display (15 pins), 03_SDRAM (15 pins), 04_MCU (5 pins), 05_Peripherals (45 pins), 06_WIFI_BLE (28 pins)
USB_5V: 01_Power (D1.2), 05_Peripherals (F1.2 R32.2)
VBAT: 01_Power (D3.2 IC1.D), 05_Peripherals (J4.1)
ACC: 01_Power (R6.2), 05_Peripherals (J4.2)
ACC_STATUS_N: 01_Power (Q1.3 R11.1 TP8.TP?), 04_MCU (U3.176)
BOOT0: 01_Power (R14.2 S2.1 S2.2 U3.166), 06_WIFI_BLE (R40.2)
CAN1_STB: 04_MCU (U3.89), 05_Peripherals (R24.2 U5.8)
ESP_CTS1: 04_MCU (U3.146), 06_WIFI_BLE (U9.19)
ESP_EN_T: 04_MCU (U3.151), 06_WIFI_BLE (R38.2)
ESP_RTS1: 04_MCU (U3.145), 06_WIFI_BLE (U9.18)
ESP_RX1: 04_MCU (U3.147), 06_WIFI_BLE (U9.20)
ESP_TX1: 04_MCU (U3.150), 06_WIFI_BLE (U9.21)
FDCAN2_RX: 04_MCU (U3.92), 05_Peripherals (U5.4)
FDCAN2_TX: 04_MCU (U3.93), 05_Peripherals (U5.1)
FMC_A0: 03_SDRAM (B2.23), 04_MCU (U3.16)
FMC_A1: 03_SDRAM (B2.24), 04_MCU (U3.17)
FMC_A2: 03_SDRAM (B2.25), 04_MCU (U3.18)
FMC_A3: 03_SDRAM (B2.26), 04_MCU (U3.19)
FMC_A4: 03_SDRAM (B2.29), 04_MCU (U3.20)
FMC_A5: 03_SDRAM (B2.30), 04_MCU (U3.21)
FMC_A6: 03_SDRAM (B2.31), 04_MCU (U3.60)
FMC_A7: 03_SDRAM (B2.32), 04_MCU (U3.63)
FMC_A8: 03_SDRAM (B2.33), 04_MCU (U3.64)
FMC_A9: 03_SDRAM (B2.34), 04_MCU (U3.65)
FMC_A10: 03_SDRAM (B2.22), 04_MCU (U3.66)
FMC_A11: 03_SDRAM (B2.35), 04_MCU (U3.67)
FMC_A12: 03_SDRAM (B2.36), 04_MCU (U3.106)
FMC_BA0: 03_SDRAM (B2.20), 04_MCU (U3.108)
FMC_BA1: 03_SDRAM (B2.21), 04_MCU (U3.109)
FMC_D0: 03_SDRAM (B2.2), 04_MCU (U3.104)
FMC_D1: 03_SDRAM (B2.4), 04_MCU (U3.105)
FMC_D2: 03_SDRAM (B2.5), 04_MCU (U3.142)
FMC_D3: 03_SDRAM (B2.7), 04_MCU (U3.143)
FMC_D4: 03_SDRAM (B2.8), 04_MCU (U3.68)
FMC_D5: 03_SDRAM (B2.10), 04_MCU (U3.69)
FMC_D6: 03_SDRAM (B2.11), 04_MCU (U3.70)
FMC_D7: 03_SDRAM (B2.13), 04_MCU (U3.73)
FMC_D8: 03_SDRAM (B2.42), 04_MCU (U3.74)
FMC_D9: 03_SDRAM (B2.44), 04_MCU (U3.75)
FMC_D10: 03_SDRAM (B2.45), 04_MCU (U3.76)
FMC_D11: 03_SDRAM (B2.47), 04_MCU (U3.77)
FMC_D12: 03_SDRAM (B2.48), 04_MCU (U3.78)
FMC_D13: 03_SDRAM (B2.50), 04_MCU (U3.96)
FMC_D14: 03_SDRAM (B2.51), 04_MCU (U3.97)
FMC_D15: 03_SDRAM (B2.53), 04_MCU (U3.98)
FMC_NBL0: 03_SDRAM (B2.15), 04_MCU (U3.169)
FMC_NBL1: 03_SDRAM (B2.39), 04_MCU (U3.170)
FMC_SDCKE0: 03_SDRAM (B2.37), 04_MCU (U3.35)
FMC_SDCLK: 03_SDRAM (B2.38), 04_MCU (R18.1)
FMC_SDNCAS: 03_SDRAM (B2.17), 04_MCU (U3.160)
FMC_SDNE0: 03_SDRAM (B2.19), 04_MCU (U3.34)
FMC_SDNRAS: 03_SDRAM (B2.18), 04_MCU (U3.59)
FMC_SDNWE: 03_SDRAM (B2.16), 04_MCU (U3.46)
GNSS_ON: 04_MCU (U3.99), 05_Peripherals (IC2.5 R23.2)
GNSS_PPS: 04_MCU (U3.100), 05_Peripherals (IC2.4)
GNSS_RX: 04_MCU (U3.94), 05_Peripherals (IC2.3)
GNSS_TX: 04_MCU (U3.95), 05_Peripherals (IC2.2)
I2C1_SCL: 01_Power (R3.1), 02_Display (B1.12), 04_MCU (U3.164), 05_Peripherals (IC3.13)
I2C1_SDA: 01_Power (R4.1), 02_Display (B1.11), 04_MCU (U3.165), 05_Peripherals (IC3.14)
IMU_INT1: 04_MCU (U3.173), 05_Peripherals (IC3.4)
IMU_INT2: 04_MCU (U3.174), 05_Peripherals (IC3.9)
LCD_B0: 02_Display (J1.21), 04_MCU (U3.3)
LCD_B1: 02_Display (J1.22), 04_MCU (U3.121)
LCD_B2: 02_Display (J1.23), 04_MCU (U3.153)
LCD_B3: 02_Display (J1.24), 04_MCU (U3.154)
LCD_B4: 02_Display (J1.25), 04_MCU (U3.155)
LCD_B5: 02_Display (J1.26), 04_MCU (U3.47)
LCD_B6: 02_Display (J1.27), 04_MCU (U3.167)
LCD_B7: 02_Display (J1.28), 04_MCU (U3.168)
LCD_BL: 02_Display (U4.4), 04_MCU (U3.138)
LCD_DCLK: 02_Display (J1.30), 04_MCU (R17.1)
LCD_DEN: 02_Display (J1.34), 04_MCU (U3.28)
LCD_DISP: 02_Display (J1.31 R16.1), 04_MCU (U3.8)
LCD_G0: 02_Display (J1.13), 04_MCU (U3.4)
LCD_G1: 02_Display (J1.14), 04_MCU (U3.5)
LCD_G2: 02_Display (J1.15), 04_MCU (U3.52)
LCD_G3: 02_Display (J1.16), 04_MCU (U3.129)
LCD_G4: 02_Display (J1.17), 04_MCU (U3.45)
LCD_G5: 02_Display (J1.18), 04_MCU (U3.80)
LCD_G6: 02_Display (J1.19), 04_MCU (U3.13)
LCD_G7: 02_Display (J1.20), 04_MCU (U3.133)
LCD_HS: 02_Display (J1.32), 04_MCU (U3.12)
LCD_R0: 02_Display (J1.5), 04_MCU (U3.43)
LCD_R1: 02_Display (J1.6), 04_MCU (U3.44)
LCD_R2: 02_Display (J1.7), 04_MCU (U3.41)
LCD_R3: 02_Display (J1.8), 04_MCU (U3.56)
LCD_R4: 02_Display (J1.9), 04_MCU (U3.51)
LCD_R5: 02_Display (J1.10), 04_MCU (U3.32)
LCD_R6: 02_Display (J1.11), 04_MCU (U3.57)
LCD_R7: 02_Display (J1.12), 04_MCU (U3.110)
LCD_VS: 02_Display (J1.33), 04_MCU (U3.11)
NRST: 01_Power (C23.2 S1.3 S1.4 U3.31), 04_MCU (J2.3), 06_WIFI_BLE (Q3.3)
PWR_HOLD: 01_Power (D5.2 R10.2 TP7.TP?), 04_MCU (U3.175)
QUADSPI_BK1_CLK: 04_MCU (R20.2), 05_Peripherals (IC4.6)
QUADSPI_BK1_IO0: 04_MCU (U3.26), 05_Peripherals (IC4.5)
QUADSPI_BK1_IO1: 04_MCU (U3.27), 05_Peripherals (IC4.2)
QUADSPI_BK1_IO2: 04_MCU (U3.25), 05_Peripherals (IC4.3)
QUADSPI_BK1_IO3: 04_MCU (U3.24), 05_Peripherals (IC4.7)
QUADSPI_BK1_NCS: 04_MCU (U3.79), 05_Peripherals (IC4.1 R31.2)
SD_DETECT: 04_MCU (U3.134), 05_Peripherals (J3.10 R30.2 U7.4)
SDMMC1_CK: 04_MCU (R19.1), 05_Peripherals (J3.5 U6.2)
SDMMC1_CMD: 04_MCU (U3.144), 05_Peripherals (J3.3 R25.2 U6.1)
SDMMC1_D0: 04_MCU (U3.117), 05_Peripherals (J3.7 R26.2 U6.4)
SDMMC1_D1: 04_MCU (U3.118), 05_Peripherals (J3.8 R27.2 U6.5)
SDMMC1_D2: 04_MCU (U3.139), 05_Peripherals (J3.1 R28.2 U7.1)
SDMMC1_D3: 04_MCU (U3.140), 05_Peripherals (J3.2 R29.2 U7.2)
TOUCH_INT: 02_Display (B1.10), 04_MCU (U3.152)
USB_D+: 04_MCU (U3.123), 05_Peripherals (J5.A6 J5.B6 U8.2)
USB_D-: 04_MCU (U3.122), 05_Peripherals (J5.A7 J5.B7 U8.1)
VBUS_DETECT: 04_MCU (U3.120), 05_Peripherals (R32.1 R33.2)

## Assembly variants
V01: not fitted C53 R16 R17